# Altium project Elizabeth.PrjPcb
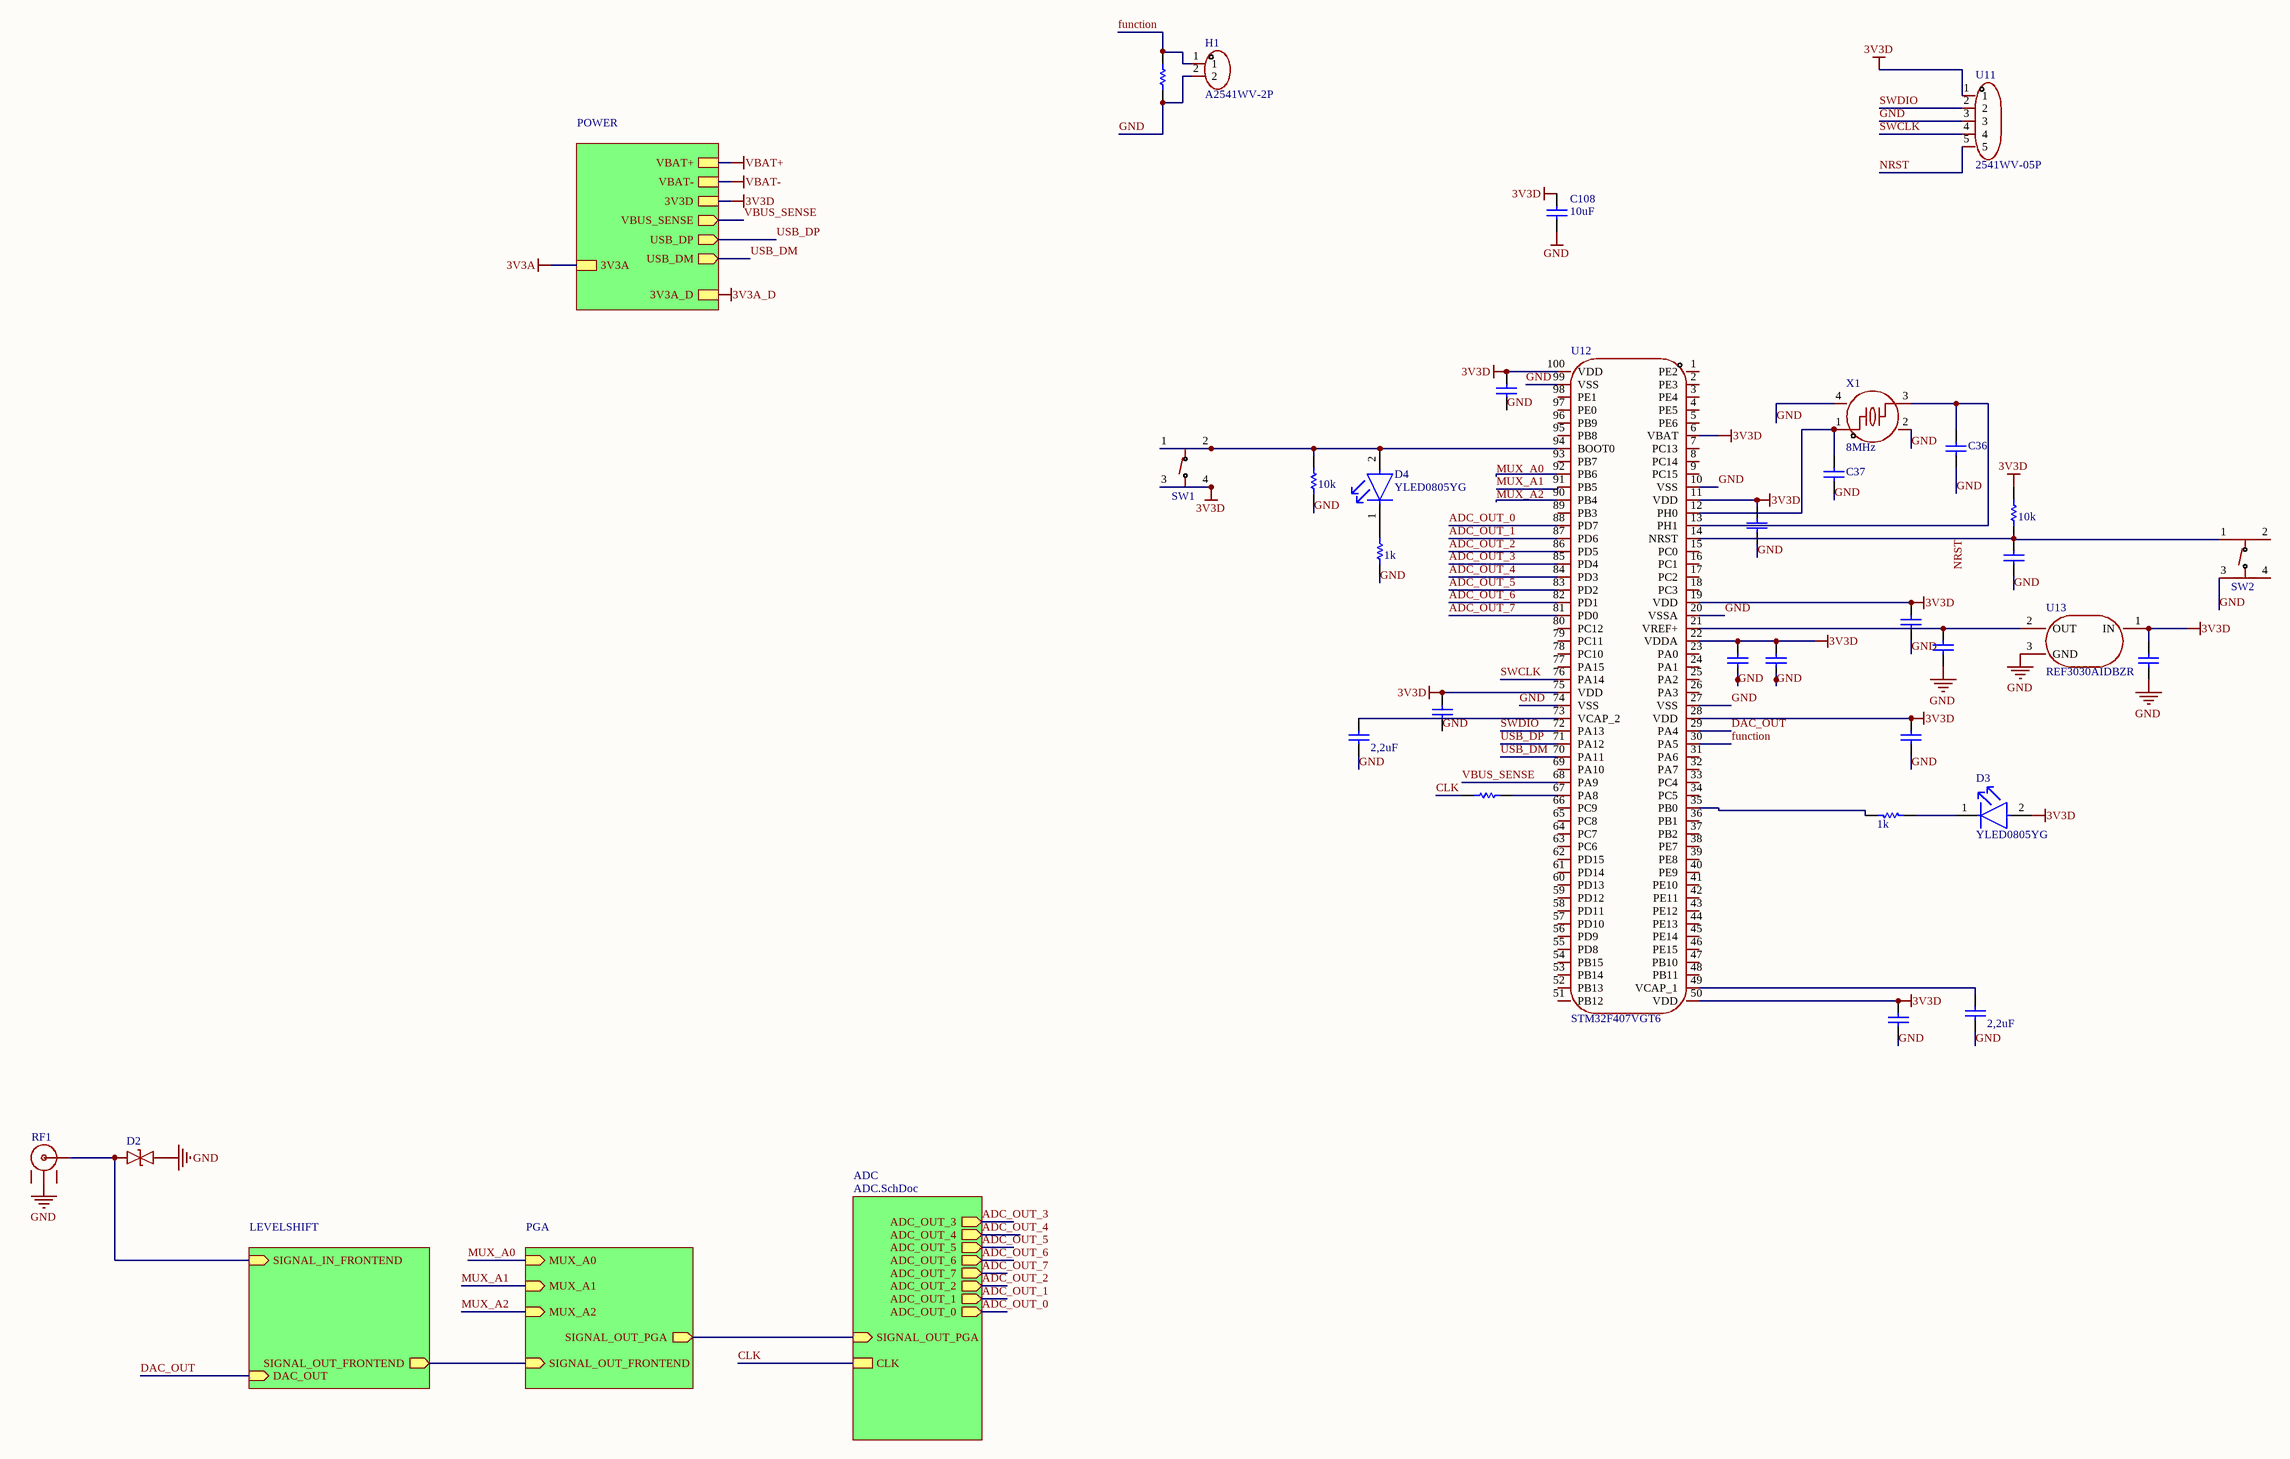
[diagram p0: STM32.SchDoc]
5 sheets, 114 parts. Net scope: hierarchical (ports join the sheet entries above them; power ports are global).
Board file: PCB1.PcbDoc
Sheets:
  STM32.SchDoc
    ADC = ADC.SchDoc
    LEVELSHIFT = FrontEnd.SchDoc
    PGA = Amplifier.SchDoc
    POWER = Power.SchDoc

## Sheet STM32.SchDoc
size D; SheetNumber: 1; SheetTotal: 5; SPICEModelCacheVGJZVZGD: <root> / <DocumentId>VGJZVZGD</DocumentId> / </root>

### Parts
C35  Cap  [0603]  (value not drawn)
C36  Cap  [0603]  (value not drawn)
C37  Cap  [0603]  (value not drawn)
C38  Cap  [0603]  (value not drawn)
C39  Cap  [0603]  (value not drawn)
C40  Cap  [0603]  (value not drawn)
C41  Cap  [0603]  (value not drawn)
C42  Cap  [0603]  (value not drawn)
C43  Cap  [0603]  (value not drawn)
C44  Cap  [0603]  (value not drawn)
C45  Cap  [0603]  (value not drawn)
C46  value 2,2uF  [0603]  (hidden comment: Cap)
C47  Cap  [0603]  (value not drawn)
C48  value 2,2uF  [0603]  (hidden comment: Cap)
C49  Cap  [0603]  (value not drawn)
C108  value 10uF  [0603]  (hidden comment: Cap)
D2  GBLC08CI-LF-T7  [SOD-323_L1.8-W1.3-LS2.5-BI]  (value not drawn)
D3  YLED0805YG  [FP-LTST-C171KGKT-MFG]
D4  YLED0805YG  [FP-LTST-C171KGKT-MFG]
H1  A2541WV-2P  [HDR-TH_P2.54-H-M_A2541WV-2P]
R40  value 10k  [0603]  (hidden comment: Res1)
R41  value 10k  [0603]  (hidden comment: Res1)
R45  Res1  [0603]  (value not drawn)
R46  value 1k  [0603]  (hidden comment: Res1)
R102  value 1k  [0603]  (hidden comment: Res1)
R103  Res1  [0603]  (value not drawn)
RF1  3GHz  [ANT-TH_KH-BNC50-3511]  (value not drawn)
SW1  TS-1187A-B-A-B  [SKQGABE010]  (value not drawn)
SW2  TS-1187A-B-A-B  [SKQGABE010]  (value not drawn)
U11  2541WV-05P  [HDR-TH_5P-P2.54-V-M]
U12  STM32F407VGT6  [LQFP-100_L14.0-W14.0-P0.50-LS16.0-BL]
U13  REF3030AIDBZR  [SOT-23-3_L2.9-W1.6-P1.90-LS2.8-BR_2]
X1  8MHz  [CRYSTAL-SMD_4P-L3.2-W2.5-BL]

### Sub-sheets
ADC = ADC.SchDoc: CLK, ADC_OUT_3 (out), ADC_OUT_4 (out), ADC_OUT_5 (out), ADC_OUT_6 (out), ADC_OUT_7 (out), ADC_OUT_2 (out), ADC_OUT_1 (out), ADC_OUT_0 (out), SIGNAL_OUT_PGA (in)
LEVELSHIFT = FrontEnd.SchDoc: SIGNAL_IN_FRONTEND (in), SIGNAL_OUT_FRONTEND (out), DAC_OUT (in)
PGA = Amplifier.SchDoc: MUX_A0 (in), MUX_A1 (in), MUX_A2 (in), SIGNAL_OUT_FRONTEND (in), SIGNAL_OUT_PGA (out)
POWER = Power.SchDoc: VBAT+, VBAT-, VBUS_SENSE (out), USB_DP (out), USB_DM (out), 3V3A, 3V3D, 3V3A_D

### Nets
3V3D: C35.2 C38.2 C40.2 C42.2 C43.2 C44.2 C45.2 C47.2 C49.2 C108.2 D3.2(A) R41.1 SW1.3(C) SW1.4(D) U11.1 U12.6(VBAT) U12.11(VDD) U12.19(VDD) U12.22(VDDA) U12.28(VDD) U12.50(VDD) U12.75(VDD) U12.100(VDD) U13.1(IN) ; sheet POWER/3V3D
GND: C35.1 C36.1 C37.1 C38.1 C39.1 C40.1 C41.1 C42.1 C43.1 C44.1 C45.1 C46.2 C47.1 C48.2 C49.1 C108.1 D2.2(A) H1.2 R40.2 R102.2 R103.2 RF1.2 SW2.3(C) U11.3 U12.10(VSS) U12.20(VSSA) U12.27(VSS) U12.74(VSS) U12.99(VSS) U13.3(GND) X1.2(GND) X1.4(GND)
ADC_OUT_0: U12.88(PD7) ; sheet ADC/ADC_OUT_0  [project net ADC_D0]
ADC_OUT_1: U12.87(PD6) ; sheet ADC/ADC_OUT_1  [project net ADC_D1]
ADC_OUT_2: U12.86(PD5) ; sheet ADC/ADC_OUT_2  [project net ADC_D2]
ADC_OUT_3: U12.85(PD4) ; sheet ADC/ADC_OUT_3  [project net ADC_D3]
ADC_OUT_4: U12.84(PD3) ; sheet ADC/ADC_OUT_4  [project net ADC_D4]
ADC_OUT_5: U12.83(PD2) ; sheet ADC/ADC_OUT_5  [project net ADC_D5]
ADC_OUT_6: U12.82(PD1) ; sheet ADC/ADC_OUT_6  [project net ADC_D6]
ADC_OUT_7: U12.81(PD0) ; sheet ADC/ADC_OUT_7  [project net ADC_D7]
CLK: R45.2 ; sheet ADC/CLK
DAC_OUT: U12.29(PA4) ; sheet LEVELSHIFT/DAC_OUT
function: H1.1 R103.1 U12.30(PA5)
MUX_A0: U12.92(PB6) ; sheet PGA/MUX_A0
MUX_A1: U12.91(PB5) ; sheet PGA/MUX_A1
MUX_A2: U12.90(PB4) ; sheet PGA/MUX_A2
NRST: C39.2 R41.2 SW2.1(A) U11.5 U12.14(NRST)
SWCLK: U11.4 U12.76(PA14)
SWDIO: U11.2 U12.72(PA13)
USB_DM: U12.70(PA11) ; sheet POWER/USB_DM
USB_DP: U12.71(PA12) ; sheet POWER/USB_DP
VBUS_SENSE: U12.68(PA9) ; sheet POWER/VBUS_SENSE
NetC8_2: D2.1(K) RF1.1(OUT) ; sheet LEVELSHIFT/SIGNAL_IN_FRONTEND
NetC9_1: sheet LEVELSHIFT/SIGNAL_OUT_FRONTEND, sheet PGA/SIGNAL_OUT_FRONTEND
NetC36_2: C36.2 U12.13(PH1) X1.3
NetC37_2: C37.2 U12.12(PH0) X1.1
NetC41_2: C41.2 U12.21(VREF+) U13.2(OUT)
NetC46_1: C46.1 U12.73(VCAP_2)
NetC48_1: C48.1 U12.49(VCAP_1)
NetD3_1: D3.1(C) R46.2
NetD4_1: D4.1(C) R102.1
NetD4_2: D4.2(A) R40.1 SW1.1(A) SW1.2(B) U12.94(BOOT0)
NetR37_1: sheet ADC/SIGNAL_OUT_PGA, sheet PGA/SIGNAL_OUT_PGA
NetR45_1: R45.1 U12.67(PA8)
NetR46_1: R46.1 U12.35(PB0)

Not connected (* = marked no-connect by the designer): RF1 3 4; SW2 2(B) 4(D); U12 1(PE2) 2(PE3) 3(PE4) 4(PE5) 5(PE6) 7(PC13) 8(PC14) 9(PC15) 15(PC0) 16(PC1) 17(PC2) 18(PC3) 23(PA0) 24(PA1) 25(PA2) 26(PA3) 31(PA6) 32(PA7) 33(PC4) 34(PC5) 36(PB1) 37(PB2) 38(PE7) 39(PE8) 40(PE9) 41(PE10) 42(PE11) 43(PE12) 44(PE13) 45(PE14) 46(PE15) 47(PB10) 48(PB11) 51(PB12) 52(PB13) 53(PB14) 54(PB15) 55(PD8) 56(PD9) 57(PD10) 58(PD11) 59(PD12) 60(PD13) 61(PD14) 62(PD15) 63(PC6) 64(PC7) 65(PC8) 66(PC9) 69(PA10) 77(PA15) 78(PC10) 79(PC11) 80(PC12) 89(PB3) 93(PB7) 95(PB8) 96(PB9) 97(PE0) 98(PE1)

### Library data of the parts
C35 C38-C42 C44 C45 C47 C49 = Cap: Capacitor; Value: 100nF; Published: 8-Jun-2000; LatestRevisionDate: 17-Jul-2002; LatestRevisionNote: Re-released for DXP Platform.; PackageReference: RAD-0.3; Publisher: Altium Limited; PackageDescription: Radial Cap, Thru-Hole; 2 Leads; 0.3 in Pin Spacing
C36 C37 = Cap: Capacitor; Value: 22pF; Published: 8-Jun-2000; LatestRevisionDate: 17-Jul-2002; LatestRevisionNote: Re-released for DXP Platform.; PackageReference: RAD-0.3; Publisher: Altium Limited; PackageDescription: Radial Cap, Thru-Hole; 2 Leads; 0.3 in Pin Spacing
C43 = Cap: Capacitor; Value: 1uF; Published: 8-Jun-2000; LatestRevisionDate: 17-Jul-2002; LatestRevisionNote: Re-released for DXP Platform.; PackageReference: RAD-0.3; Publisher: Altium Limited; PackageDescription: Radial Cap, Thru-Hole; 2 Leads; 0.3 in Pin Spacing
C46 C48 C108 = Cap: Capacitor; Published: 8-Jun-2000; LatestRevisionDate: 17-Jul-2002; LatestRevisionNote: Re-released for DXP Platform.; PackageReference: RAD-0.3; Publisher: Altium Limited; PackageDescription: Radial Cap, Thru-Hole; 2 Leads; 0.3 in Pin Spacing
D2 = GBLC08CI-LF-T7: Bidirectional TVS/ESD protection diode, 8 V standoff, 13.4 V clamping, 0.6 pF capacitance
D3 D4 = CMP-22017-000037-1: LED GREEN CLEAR SMD; Number of LEDs: 1; Viewing Angle: 130°; Lens Style: Rectangular; Dominant Wavelength: 571nm; Test Current: 20mA; Luminous Intensity: 35mcd; Power Rating: 75mW; Forward Voltage: 2.4V; Forward Current: 30mA; Reverse Voltage: 5V; Lens Color: Colorless; Wavelength: 574nm; Height: 0.8mm; Illumination Color: Green; Length: 2mm; Case/Package: 0805; Number of Pins: 2; Number of Elements: 1; Package Quantity: 1; Depth: 1.25mm; Lens Transparency: Clear; Width: 1.25mm; Color: Green; Radiation Hardening: No; Mount: Surface Mount; Packaging: Tape and Reel; Case Code (Metric): 2012; Lead Free: Lead Free; Max Operating Temperature: 85°C; Min Operating Temperature: -55°C; Case Code (Imperial): 0805; Power Dissipation: 75mW
H1 = A2541WV-2P_C225477: 2-pin male pin header, 2.54 mm pitch, single-row, straight through-hole, 3 A, 250 V.
R40 R41 R46 R102 = Res1: Resistor; Published: 8-Jun-2000; LatestRevisionDate: 17-Jul-2002; LatestRevisionNote: Re-released for DXP Platform.; PackageReference: AXIAL-0.3; Publisher: Altium Limited; PackageDescription: Axial Device, Thru-Hole; 2 Leads; 0.3 in Pin Spacing
R45 = Res1: Resistor; Value: 22; Published: 8-Jun-2000; LatestRevisionDate: 17-Jul-2002; LatestRevisionNote: Re-released for DXP Platform.; PackageReference: AXIAL-0.3; Publisher: Altium Limited; PackageDescription: Axial Device, Thru-Hole; 2 Leads; 0.3 in Pin Spacing
R103 = Res1: Resistor; Value: 1k; Published: 8-Jun-2000; LatestRevisionDate: 17-Jul-2002; LatestRevisionNote: Re-released for DXP Platform.; PackageReference: AXIAL-0.3; Publisher: Altium Limited; PackageDescription: Axial Device, Thru-Hole; 2 Leads; 0.3 in Pin Spacing
RF1 = KH-BNC50-3511: 50 Ω right-angle BNC PCB connector, through-hole, DC–3 GHz, 9.5 mm interface
SW1 SW2 = TS-1187A-B-A-B: SMD tactile pushbutton switch, SPST-NO, 12 V, 50 mA, 5.1 × 5.1 × 1.5 mm.
U11 = 2541WV-05P: 5-pin single-row male pin header, 2.54 mm pitch, through-hole, straight.
U13 = REF3030AIDBZR: 3.0 V precision voltage reference, ±0.2% accuracy, 25 mA output
X1 = 0132M4-8000F18DZNGL

## Sheet ADC.SchDoc
size A; SheetNumber: 5; SheetTotal: 5
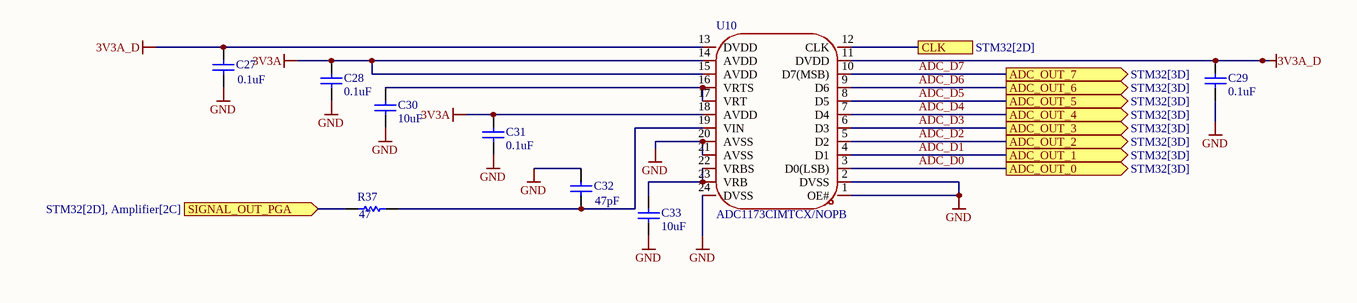
[diagram p1: ADC.SchDoc]

### Parts
C27  value 0.1uF  [0603]  (hidden comment: Cap)
C28  value 0.1uF  [0603]  (hidden comment: Cap)
C29  value 0.1uF  [0603]  (hidden comment: Cap)
C30  value 10uF  [0603]  (hidden comment: Cap)
C31  value 0.1uF  [0603]  (hidden comment: Cap)
C32  value 47pF  [0603]  (hidden comment: Cap)
C33  value 10uF  [0603]  (hidden comment: Cap)
R37  value 47  [0603]  (hidden comment: Res1)
U10  ADC1173CIMTCX/NOPB  [TSSOP-24]

### Ports
ADC_OUT_0 (out, see STM32[3D]), ADC_OUT_1 (out, see STM32[3D]), ADC_OUT_2 (out, see STM32[3D]), ADC_OUT_3 (out, see STM32[3D]), ADC_OUT_4 (out, see STM32[3D]), ADC_OUT_5 (out, see STM32[3D]), ADC_OUT_6 (out, see STM32[3D]), ADC_OUT_7 (out, see STM32[3D]), CLK (see STM32[2D]), SIGNAL_OUT_PGA (in, see STM32[2D], Amplifier[2C])

### Nets
3V3A: C28.1 C31.2 U10.14(AVDD) U10.15(AVDD) U10.18(AVDD)
3V3A_D: C27.1 C29.2 U10.11(DVDD) U10.13(DVDD)
GND: C27.2 C28.2 C29.1 C30.1 C31.1 C32.2 C33.1 U10.1(OE#) U10.2(DVSS) U10.20(AVSS) U10.21(AVSS) U10.24(DVSS)
ADC_D0: U10.3(D0(LSB)) ; port ADC_OUT_0
ADC_D1: U10.4(D1) ; port ADC_OUT_1
ADC_D2: U10.5(D2) ; port ADC_OUT_2
ADC_D3: U10.6(D3) ; port ADC_OUT_3
ADC_D4: U10.7(D4) ; port ADC_OUT_4
ADC_D5: U10.8(D5) ; port ADC_OUT_5
ADC_D6: U10.9(D6) ; port ADC_OUT_6
ADC_D7: U10.10(D7(MSB)) ; port ADC_OUT_7
CLK: U10.12(CLK) ; port CLK
NetC30_2: C30.2 U10.16(VRTS) U10.17(VRT)
NetC32_1: C32.1 R37.2 U10.19(VIN)
NetC33_2: C33.2 U10.22(VRBS) U10.23(VRB)
NetR37_1: R37.1 ; port SIGNAL_OUT_PGA

### Library data of the parts
C27-C33 = Cap: Capacitor; Published: 8-Jun-2000; LatestRevisionDate: 17-Jul-2002; LatestRevisionNote: Re-released for DXP Platform.; PackageReference: RAD-0.3; Publisher: Altium Limited; PackageDescription: Radial Cap, Thru-Hole; 2 Leads; 0.3 in Pin Spacing
R37 = Res1: Resistor; Published: 8-Jun-2000; LatestRevisionDate: 17-Jul-2002; LatestRevisionNote: Re-released for DXP Platform.; PackageReference: AXIAL-0.3; Publisher: Altium Limited; PackageDescription: Axial Device, Thru-Hole; 2 Leads; 0.3 in Pin Spacing
U10 = ADC1173CIMTCX/NOPB: 8-bit, 15 MSPS single-channel ADC, 3 V supply

## Sheet FrontEnd.SchDoc
size B; SheetNumber: 3; SheetTotal: 5; SPICEModelCacheLCCOZNWX: <root> / <DocumentId>LCCOZNWX</DocumentId> / </root>
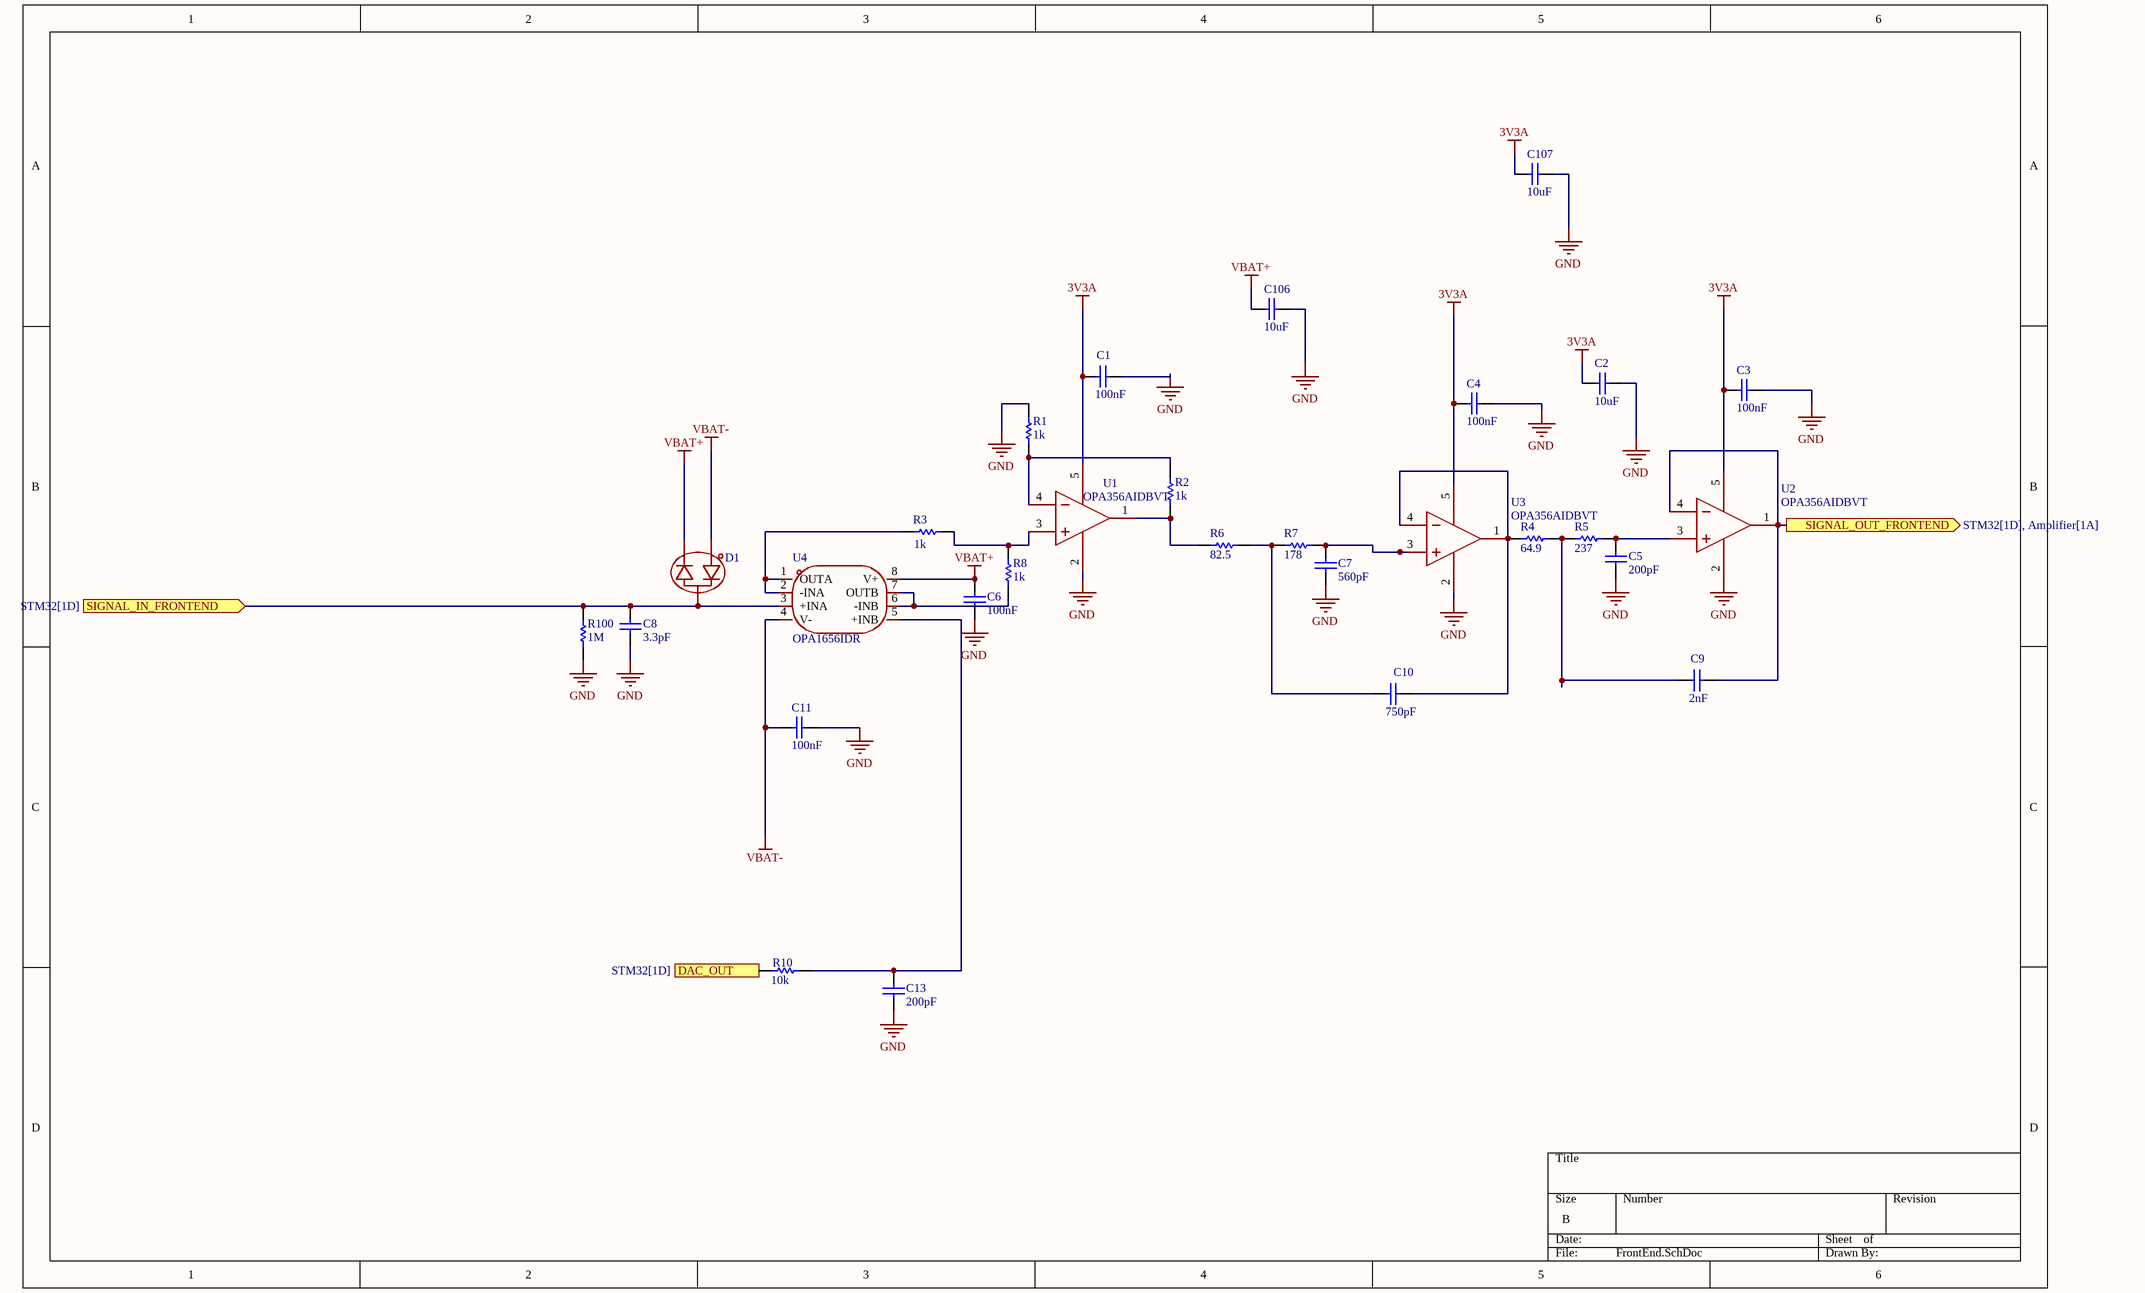
[diagram p2: FrontEnd.SchDoc]

### Parts
C1  value 100nF  [0603]  (hidden comment: Cap)
C2  value 10uF  [0603]  (hidden comment: Cap)
C3  value 100nF  [0603]  (hidden comment: Cap)
C4  value 100nF  [0603]  (hidden comment: Cap)
C5  value 200pF  [0603]  (hidden comment: Cap)
C6  value 100nF  [0603]  (hidden comment: Cap)
C7  value 560pF  [0603]  (hidden comment: Cap)
C8  value 3.3pF  [0603]  (hidden comment: Cap)
C9  value 2nF  [0603]  (hidden comment: Cap)
C10  value 750pF  [0603]  (hidden comment: Cap)
C11  value 100nF  [0603]  (hidden comment: Cap)
C13  value 200pF  [0603]  (hidden comment: Cap)
C106  value 10uF  [0603]  (hidden comment: Cap)
C107  value 10uF  [0603]  (hidden comment: Cap)
D1  YLED0805YG  [SOT-23-3]  (value not drawn)
R1  value 1k  [0603]  (hidden comment: Res1)
R2  value 1k  [0603]  (hidden comment: Res1)
R3  value 1k  [0603]  (hidden comment: Res1)
R4  value 64.9  [0603]  (hidden comment: Res1)
R5  value 237  [0603]  (hidden comment: Res1)
R6  value 82.5  [0603]  (hidden comment: Res1)
R7  value 178  [0603]  (hidden comment: Res1)
R8  value 1k  [0603]  (hidden comment: Res1)
R10  value 10k  [0603]  (hidden comment: Res1)
R100  value 1M  [0603]  (hidden comment: Res1)
U1  OPA356AIDBVT  [SOT-23-5]
U2  OPA356AIDBVT  [SOT-23-5]
U3  OPA356AIDBVT  [SOT-23-5]
U4  OPA1656IDR  [SOIC-8]

### Ports
DAC_OUT (in, see STM32[1D]), SIGNAL_IN_FRONTEND (in, see STM32[1D]), SIGNAL_OUT_FRONTEND (out, see STM32[1D], Amplifier[1A])

### Nets
3V3A: C1.1 C2.1 C3.1 C4.1 C107.1 U1.5(V+) U2.5(V+) U3.5(V+)
GND: C1.2 C2.2 C3.2 C4.2 C5.2 C6.1 C7.1 C8.1 C11.2 C13.1 C106.2 C107.2 R1.1 R100.1 U1.2(V-) U2.2(V-) U3.2(V-)
VBAT+: C6.2 C106.1 D1.2 U4.8(V+)
VBAT-: C11.1 D1.1 U4.4(V-)
DAC_OUT: R10.2 ; port DAC_OUT
NetC5_1: C5.1 R5.1 U2.3(IN+)
NetC7_2: C7.2 R7.1 U3.3(IN+)
NetC8_2: C8.2 D1.3 R100.2 U4.3(+INA) ; port SIGNAL_IN_FRONTEND
NetC9_1: C9.1 U2.1(OUT) U2.4(IN-) ; port SIGNAL_OUT_FRONTEND
NetC9_2: C9.2 R4.1 R5.2
NetC10_1: C10.1 R4.2 U3.1(OUT) U3.4(IN-)
NetC10_2: C10.2 R6.1 R7.2
NetC13_2: C13.2 R10.1 U4.5(+INB)
NetR1_2: R1.2 R2.1 U1.4(IN-)
NetR2_2: R2.2 R6.2 U1.1(OUT)
NetR3_1: R3.1 U4.1(OUTA) U4.2(-INA)
NetR3_2: R3.2 R8.2 U1.3(IN+)
NetR8_1: R8.1 U4.6(-INB) U4.7(OUTB)

### Library data of the parts
C1-C11 C13 C106 C107 = Cap: Capacitor; Published: 8-Jun-2000; LatestRevisionDate: 17-Jul-2002; LatestRevisionNote: Re-released for DXP Platform.; PackageReference: RAD-0.3; Publisher: Altium Limited; PackageDescription: Radial Cap, Thru-Hole; 2 Leads; 0.3 in Pin Spacing
D1 = BAS7004E6327HTSA1: Dual Schottky diode, 70 V, 70 mA, SOT-23 package.
R1-R8 R10 R100 = Res1: Resistor; Published: 8-Jun-2000; LatestRevisionDate: 17-Jul-2002; LatestRevisionNote: Re-released for DXP Platform.; PackageReference: AXIAL-0.3; Publisher: Altium Limited; PackageDescription: Axial Device, Thru-Hole; 2 Leads; 0.3 in Pin Spacing
U1-U3 = OPA356AIDBVT: High-speed CMOS single operational amplifier, 200 MHz GBW, rail-to-rail output
U4 = OPA1656IDR: Dual FET-input audio op-amp, 2.9nV/√Hz, 53MHz GBW, SOIC-8

## Sheet Amplifier.SchDoc
size A; SheetNumber: 4; SheetTotal: 5
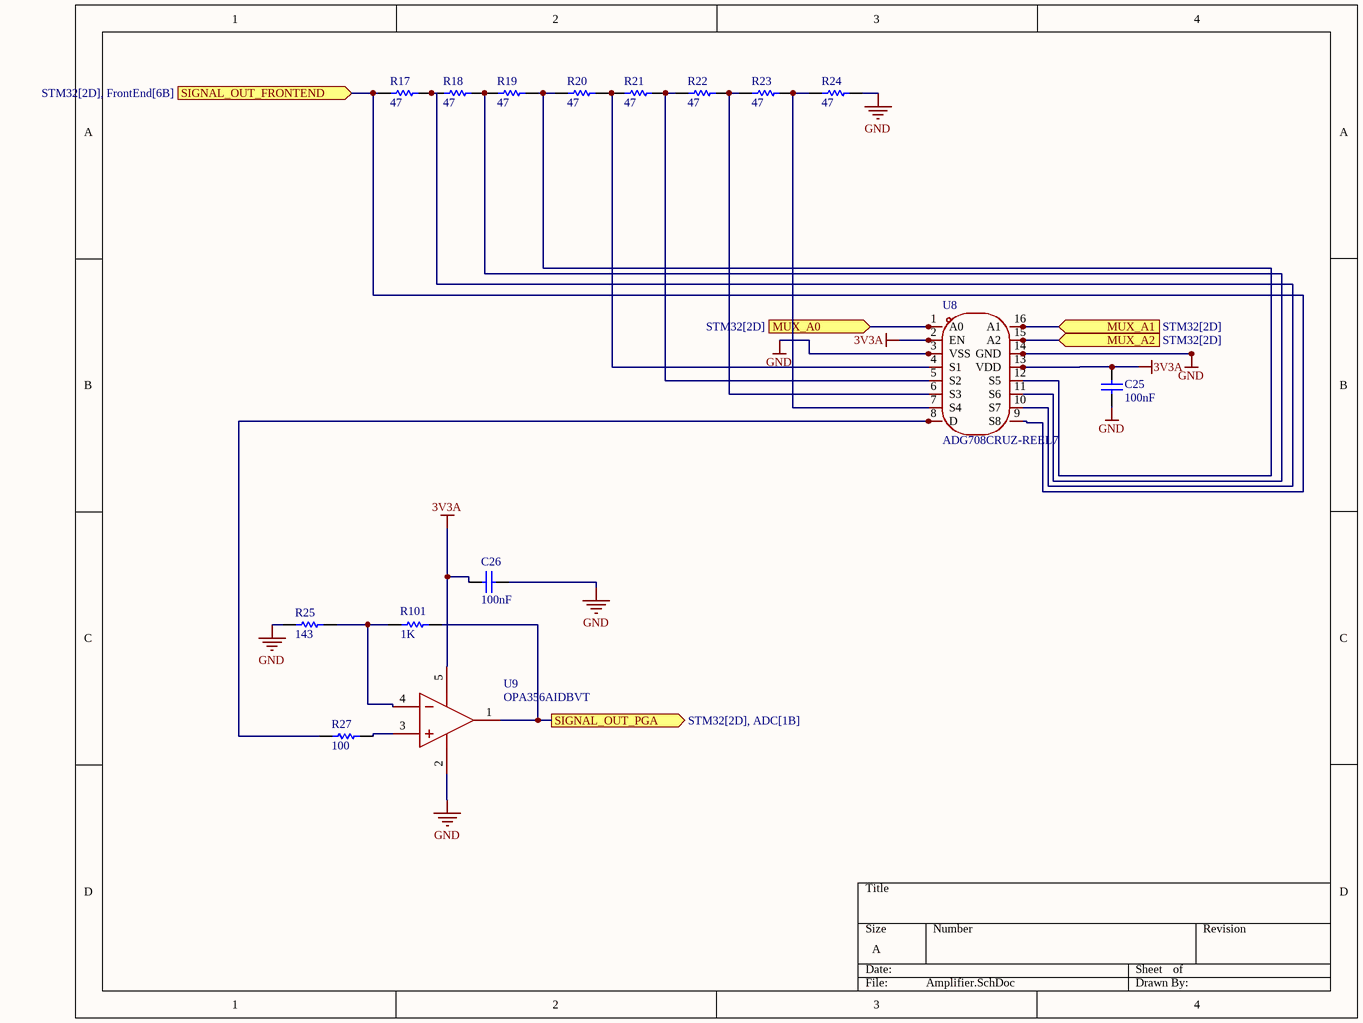
[diagram p3: Amplifier.SchDoc]

### Parts
C25  value 100nF  [0603]  (hidden comment: Cap)
C26  value 100nF  [0603]  (hidden comment: Cap)
R17  value 47  [0603]  (hidden comment: Res1)
R18  value 47  [0603]  (hidden comment: Res1)
R19  value 47  [0603]  (hidden comment: Res1)
R20  value 47  [0603]  (hidden comment: Res1)
R21  value 47  [0603]  (hidden comment: Res1)
R22  value 47  [0603]  (hidden comment: Res1)
R23  value 47  [0603]  (hidden comment: Res1)
R24  value 47  [0603]  (hidden comment: Res1)
R25  value 143  [0603]  (hidden comment: Res1)
R27  value 100  [0603]  (hidden comment: Res1)
R101  value 1K  [0603]  (hidden comment: Res1)
U8  ADG708CRUZ-REEL7  [TSSOP-16]
U9  OPA356AIDBVT  [SOT-23-5]

### Ports
MUX_A0 (in, see STM32[2D]), MUX_A1 (in, see STM32[2D]), MUX_A2 (in, see STM32[2D]), SIGNAL_OUT_FRONTEND (in, see STM32[2D], FrontEnd[6B]), SIGNAL_OUT_PGA (out, see STM32[2D], ADC[1B])

### Nets
3V3A: C25.2 C26.1 U8.2(EN) U8.13(VDD) U9.5(V+)
GND: C25.1 C26.2 R24.1 R25.1 U8.3(VSS) U8.14(GND) U9.2(V-)
MUX_A0: U8.1(A0) ; port MUX_A0
MUX_A1: U8.16(A1) ; port MUX_A1
MUX_A2: U8.15(A2) ; port MUX_A2
NetC9_1: R17.2 U8.9(S8) ; port SIGNAL_OUT_FRONTEND
NetR17_1: R17.1 R18.2 U8.10(S7)
NetR18_1: R18.1 R19.2 U8.11(S6)
NetR19_1: R19.1 R20.2 U8.12(S5)
NetR20_1: R20.1 R21.2 U8.4(S1)
NetR21_1: R21.1 R22.2 U8.5(S2)
NetR22_1: R22.1 R23.2 U8.6(S3)
NetR23_1: R23.1 R24.2 U8.7(S4)
NetR25_2: R25.2 R101.1 U9.4(IN-)
NetR27_1: R27.1 U9.3(IN+)
NetR27_2: R27.2 U8.8(D)
NetR37_1: R101.2 U9.1(OUT) ; port SIGNAL_OUT_PGA

### Library data of the parts
C25 C26 = Cap: Capacitor; Published: 8-Jun-2000; LatestRevisionDate: 17-Jul-2002; LatestRevisionNote: Re-released for DXP Platform.; PackageReference: RAD-0.3; Publisher: Altium Limited; PackageDescription: Radial Cap, Thru-Hole; 2 Leads; 0.3 in Pin Spacing
R17-R25 R27 R101 = Res1: Resistor; Published: 8-Jun-2000; LatestRevisionDate: 17-Jul-2002; LatestRevisionNote: Re-released for DXP Platform.; PackageReference: AXIAL-0.3; Publisher: Altium Limited; PackageDescription: Axial Device, Thru-Hole; 2 Leads; 0.3 in Pin Spacing
U8 = ADG708CRUZ-REEL7: 8:1 low-voltage analog multiplexer/switch, 4.5 Ω max RON, 55 MHz bandwidth
U9 = OPA356AIDBVT: as U1 on sheet FrontEnd

## Sheet Power.SchDoc
size B; SheetNumber: 2; SheetTotal: 5; SPICEModelCacheRRGICJWA: <root> / <DocumentId>RRGICJWA</DocumentId> / </root>
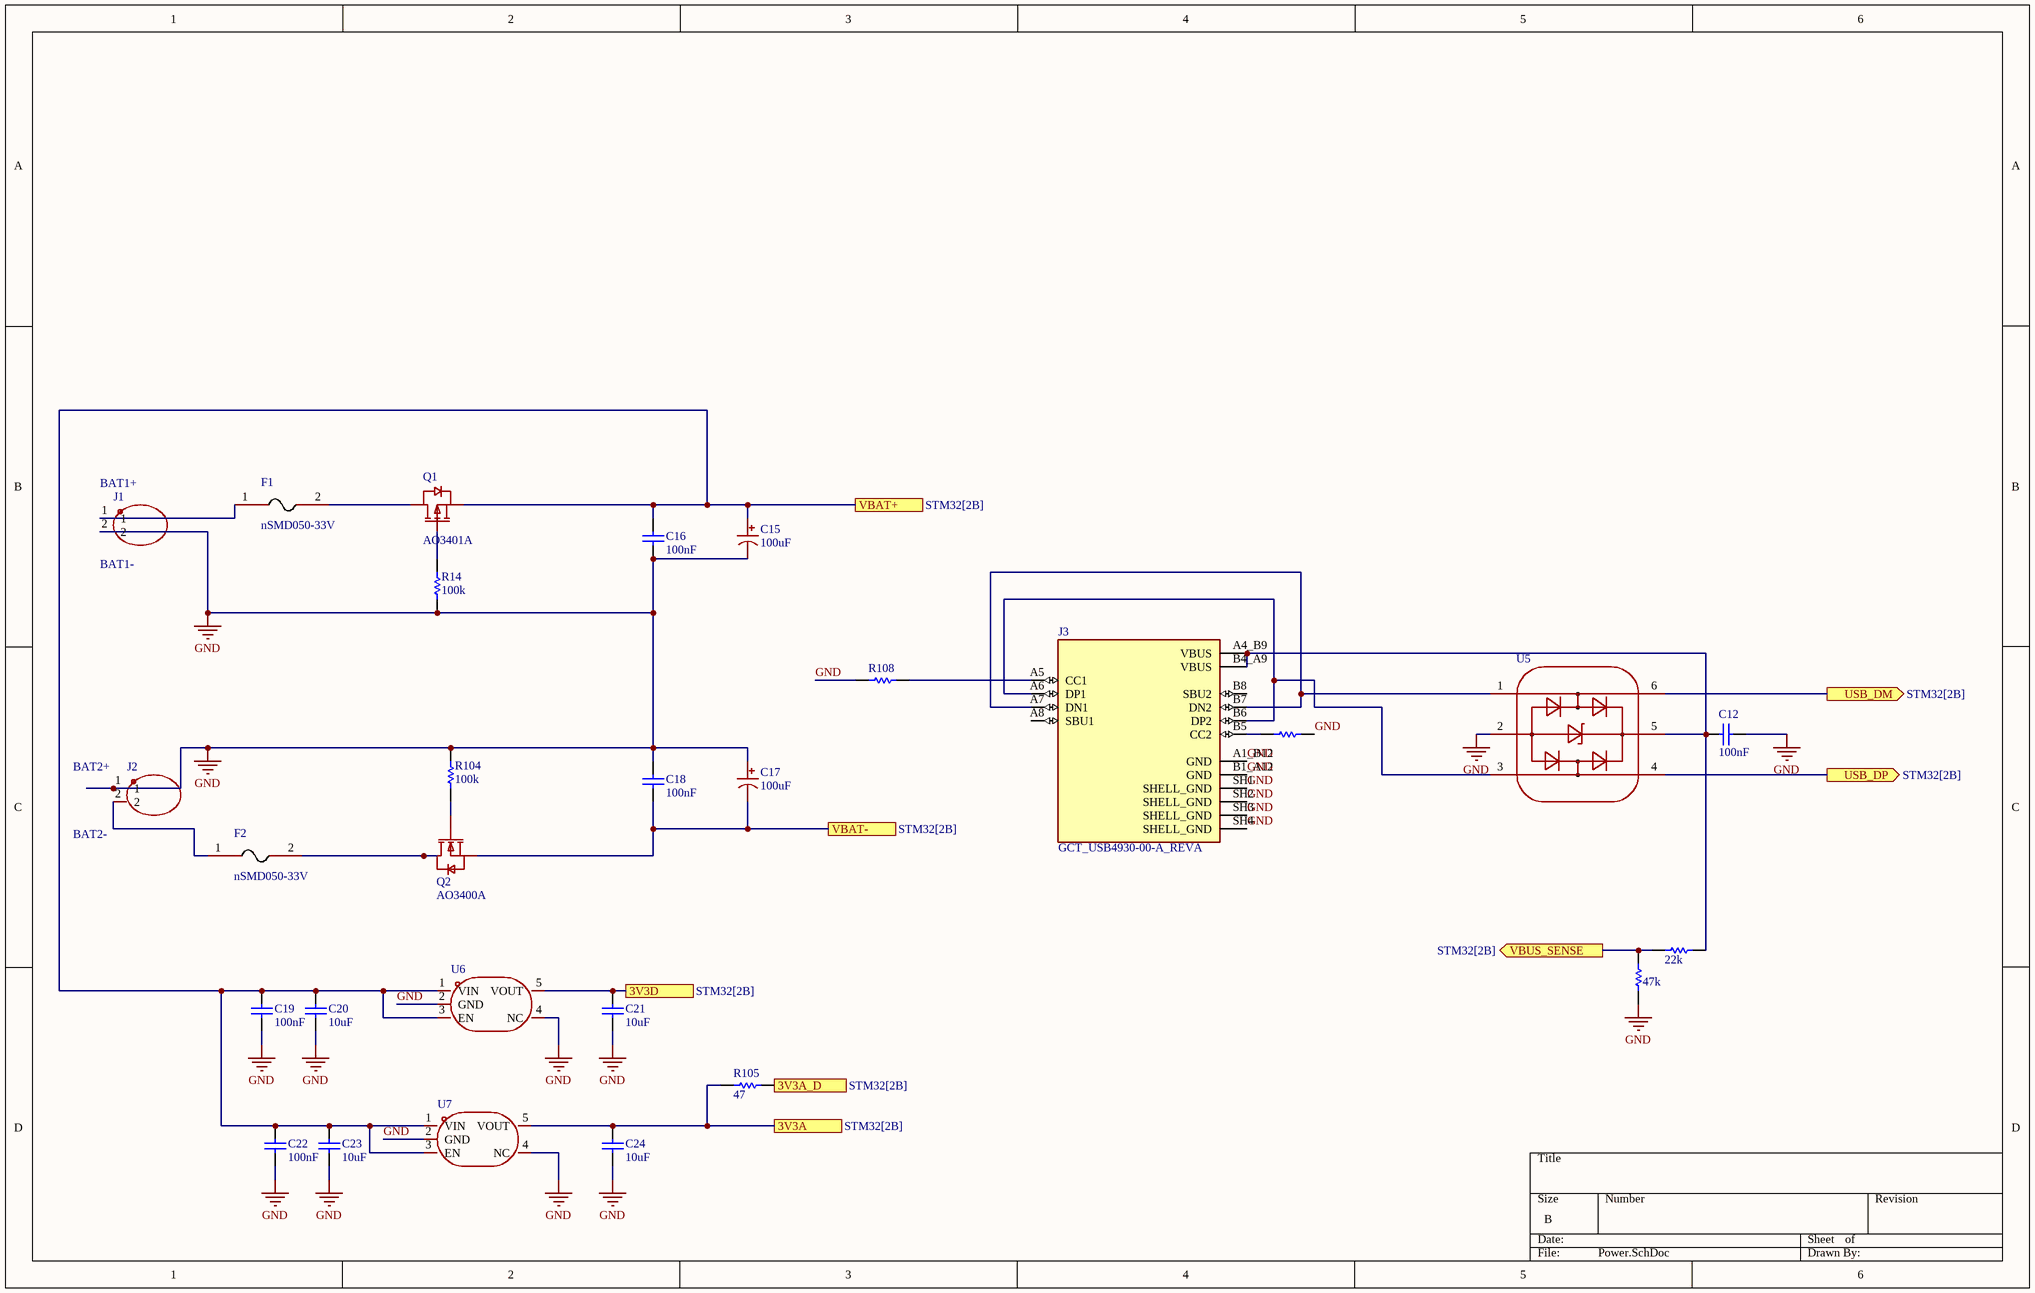
[diagram p4: Power.SchDoc]

### Parts
C12  value 100nF  [0603]  (hidden comment: Cap)
C15  100uF  [CAP-SMD_BD8.0-L8.3-W8.3-FD]
C16  value 100nF  [0805]  (hidden comment: Cap)
C17  100uF  [CAP-SMD_BD8.0-L8.3-W8.3-FD]
C18  value 100nF  [0805]  (hidden comment: Cap)
C19  value 100nF  [0805]  (hidden comment: Cap)
C20  value 10uF  [0805]  (hidden comment: Cap)
C21  value 10uF  [0805]  (hidden comment: Cap)
C22  value 100nF  [0805]  (hidden comment: Cap)
C23  value 10uF  [0805]  (hidden comment: Cap)
C24  value 10uF  [0805]  (hidden comment: Cap)
F1  nSMD050-33V  [1206]
F2  nSMD050-33V  [1206]
J1  B2B-XH-A(LF)(SN)  [B2B-XH-A(LF)(SN)]  (value not drawn)
J2  B2B-XH-A(LF)(SN)  [B2B-XH-A(LF)(SN)]  (value not drawn)
J3  GCT_USB4930-00-A_REVA  [GCT_USB4930-00-A_REVA]
Q1  AO3401A  [SOT-23-3_L2.9-W1.6-P1.90-LS2.8-BR]
Q2  AO3400A  [SOT-23-3_L2.9-W1.3-P1.90-LS2.4-BR]
R11  Res1  [0603]  (value not drawn)
R12  value 22k  [0603]  (hidden comment: Res1)
R13  value 47k  [0603]  (hidden comment: Res1)
R14  value 100k  [0805]  (hidden comment: Res1)
R104  value 100k  [0805]  (hidden comment: Res1)
R105  value 47  [0603]  (hidden comment: Res1)
R108  Res1  [0603]  (value not drawn)
U5  USBLC6-2SC6_C5261088  [SOT-23-6_L2.9-W1.6-P0.95-LS2.8-BR]  (value not drawn)
U6  AP2112K-3.3TRG1(MS)  [SOT-23-5_L2.9-W1.6-P0.95-LS2.7-BR]  (value not drawn)
U7  AP2112K-3.3TRG1(MS)  [SOT-23-5_L2.9-W1.6-P0.95-LS2.7-BR]  (value not drawn)

### Ports
3V3A (see STM32[2B]), 3V3A_D (see STM32[2B]), 3V3D (see STM32[2B]), USB_DM (out, see STM32[2B]), USB_DP (out, see STM32[2B]), VBAT+ (see STM32[2B]), VBAT- (see STM32[2B]), VBUS_SENSE (out, see STM32[2B])

### Nets
3V3A: C24.2 R105.1 U7.5(VOUT) ; port 3V3A
3V3A_D: R105.2 ; port 3V3A_D
3V3D: C21.2 U6.5(VOUT) ; port 3V3D
GND: C12.1 C15.2 C16.1 C17.1 C18.2 C19.1 C20.1 C21.1 C22.1 C23.1 C24.1 J1.2 J2.1 J3.A1_B12(GND) J3.B1_A12(GND) J3.SH1(SHELL_GND) J3.SH2(SHELL_GND) J3.SH3(SHELL_GND) J3.SH4(SHELL_GND) R11.2 R13.1 R14.2 R104.1 R108.2 U5.2 U6.2(GND) U6.4(NC) U7.2(GND) U7.4(NC)
VBAT+: C15.1 C16.2 C19.2 C20.2 C22.2 C23.2 Q1.2(S) U6.1(VIN) U6.3(EN) U7.1(VIN) U7.3(EN) ; port VBAT+
VBAT-: C17.2 C18.1 Q2.2(S) ; port VBAT-
USB_DM: U5.6 ; port USB_DM
USB_DP: U5.4 ; port USB_DP
VBUS_SENSE: R12.2 R13.2 ; port VBUS_SENSE
NetC12_2: C12.2 J3.A4_B9(VBUS) J3.B4_A9(VBUS) R12.1 U5.5
NetF1_1: F1.1 J1.1
NetF1_2: F1.2 Q1.3(D)
NetF2_1: F2.1 J2.2
NetF2_2: F2.2 Q2.3(D)
NetJ3_A5: J3.A5(CC1) R108.1
NetJ3_A6: J3.A6(DP1) J3.B6(DP2) U5.3
NetJ3_A7: J3.A7(DN1) J3.B7(DN2) U5.1
NetJ3_B5: J3.B5(CC2) R11.1
NetQ1_1: Q1.1(G) R14.1
NetQ2_1: Q2.1(G) R104.2

Not connected (* = marked no-connect by the designer): J3 A8(SBU1) B8(SBU2)

### Notes on the sheet
- (near J1) BAT1+
- (near J1) BAT1-
- (near J2) BAT2+
- (near J2) BAT2-

### Library data of the parts
C12 C16 C18-C24 = Cap: Capacitor; Published: 8-Jun-2000; LatestRevisionDate: 17-Jul-2002; LatestRevisionNote: Re-released for DXP Platform.; PackageReference: RAD-0.3; Publisher: Altium Limited; PackageDescription: Radial Cap, Thru-Hole; 2 Leads; 0.3 in Pin Spacing
C15 C17 = VT1H101M0810: 100 µF, 50 V aluminum electrolytic capacitor, ±20%, SMD, 8 × 10.2 mm, 105°C
F1 F2 = nSMD050-33V: Resettable PTC fuse, 0.5 A hold current, 33 V max
J1 J2 = B2B-XH-A(LF)(SN): 2-pin JST XH series wire-to-board header, 2.5 mm pitch, straight through-hole, 3 A, 250 V
J3 = GCT_USB4930-00-A_REVA: Type C USB 2.0 Connector
Q1 = AO3401A_C5379091: P-channel MOSFET, −30 V, −4 A, low RDS(on)
Q2 = AO3400A_C42419946: N-channel MOSFET, 30 V, 5.7 A, low RDS(on)
R11 R108 = Res1: Resistor; Value: 5.1K; Published: 8-Jun-2000; LatestRevisionDate: 17-Jul-2002; LatestRevisionNote: Re-released for DXP Platform.; PackageReference: AXIAL-0.3; Publisher: Altium Limited; PackageDescription: Axial Device, Thru-Hole; 2 Leads; 0.3 in Pin Spacing
R12-R14 R104 R105 = Res1: Resistor; Published: 8-Jun-2000; LatestRevisionDate: 17-Jul-2002; LatestRevisionNote: Re-released for DXP Platform.; PackageReference: AXIAL-0.3; Publisher: Altium Limited; PackageDescription: Axial Device, Thru-Hole; 2 Leads; 0.3 in Pin Spacing
U6 U7 = AP2112K-3.3TRG1(MS): 3.3 V, 600 mA fixed-output LDO regulator with enable

## Nets that join several sheets
3V3A: ADC (5 pins), FrontEnd (8 pins), Amplifier (5 pins), Power (C24.2 R105.1 U7.5)
3V3A_D: ADC (C27.1 C29.2 U10.11 U10.13), Power (R105.2)
3V3D: STM32 (24 pins), Power (C21.2 U6.5)
GND: STM32 (32 pins), ADC (12 pins), FrontEnd (17 pins), Amplifier (7 pins), Power (29 pins)
VBAT+: FrontEnd (C6.2 C106.1 D1.2 U4.8), Power (11 pins)
VBAT-: FrontEnd (C11.1 D1.1 U4.4), Power (C17.2 C18.1 Q2.2)
ADC_D0: STM32 (U12.88), ADC (U10.3)
ADC_D1: STM32 (U12.87), ADC (U10.4)
ADC_D2: STM32 (U12.86), ADC (U10.5)
ADC_D3: STM32 (U12.85), ADC (U10.6)
ADC_D4: STM32 (U12.84), ADC (U10.7)
ADC_D5: STM32 (U12.83), ADC (U10.8)
ADC_D6: STM32 (U12.82), ADC (U10.9)
ADC_D7: STM32 (U12.81), ADC (U10.10)
CLK: STM32 (R45.2), ADC (U10.12)
DAC_OUT: STM32 (U12.29), FrontEnd (R10.2)
MUX_A0: STM32 (U12.92), Amplifier (U8.1)
MUX_A1: STM32 (U12.91), Amplifier (U8.16)
MUX_A2: STM32 (U12.90), Amplifier (U8.15)
NetC8_2: STM32 (D2.1 RF1.1), FrontEnd (C8.2 D1.3 R100.2 U4.3)
NetC9_1: FrontEnd (C9.1 U2.1 U2.4), Amplifier (R17.2 U8.9)
NetR37_1: ADC (R37.1), Amplifier (R101.2 U9.1)
USB_DM: STM32 (U12.70), Power (U5.6)
USB_DP: STM32 (U12.71), Power (U5.4)
VBUS_SENSE: STM32 (U12.68), Power (R12.2 R13.2)